# Altium schematic sheet HairColorDispenser.SchDoc: Hair Dispenser
size A3; DrawnBy: Markov Marko; Engineer: Markov Marko; Organization: M2Embedded; Address1: 21000 Novi Sad; Address2: Serbia; Address3: markov_marko@hotmail.com; Revision: 1.00; SheetNumber: 1; SheetTotal: 1; Design Engeneer:: Markov Marko
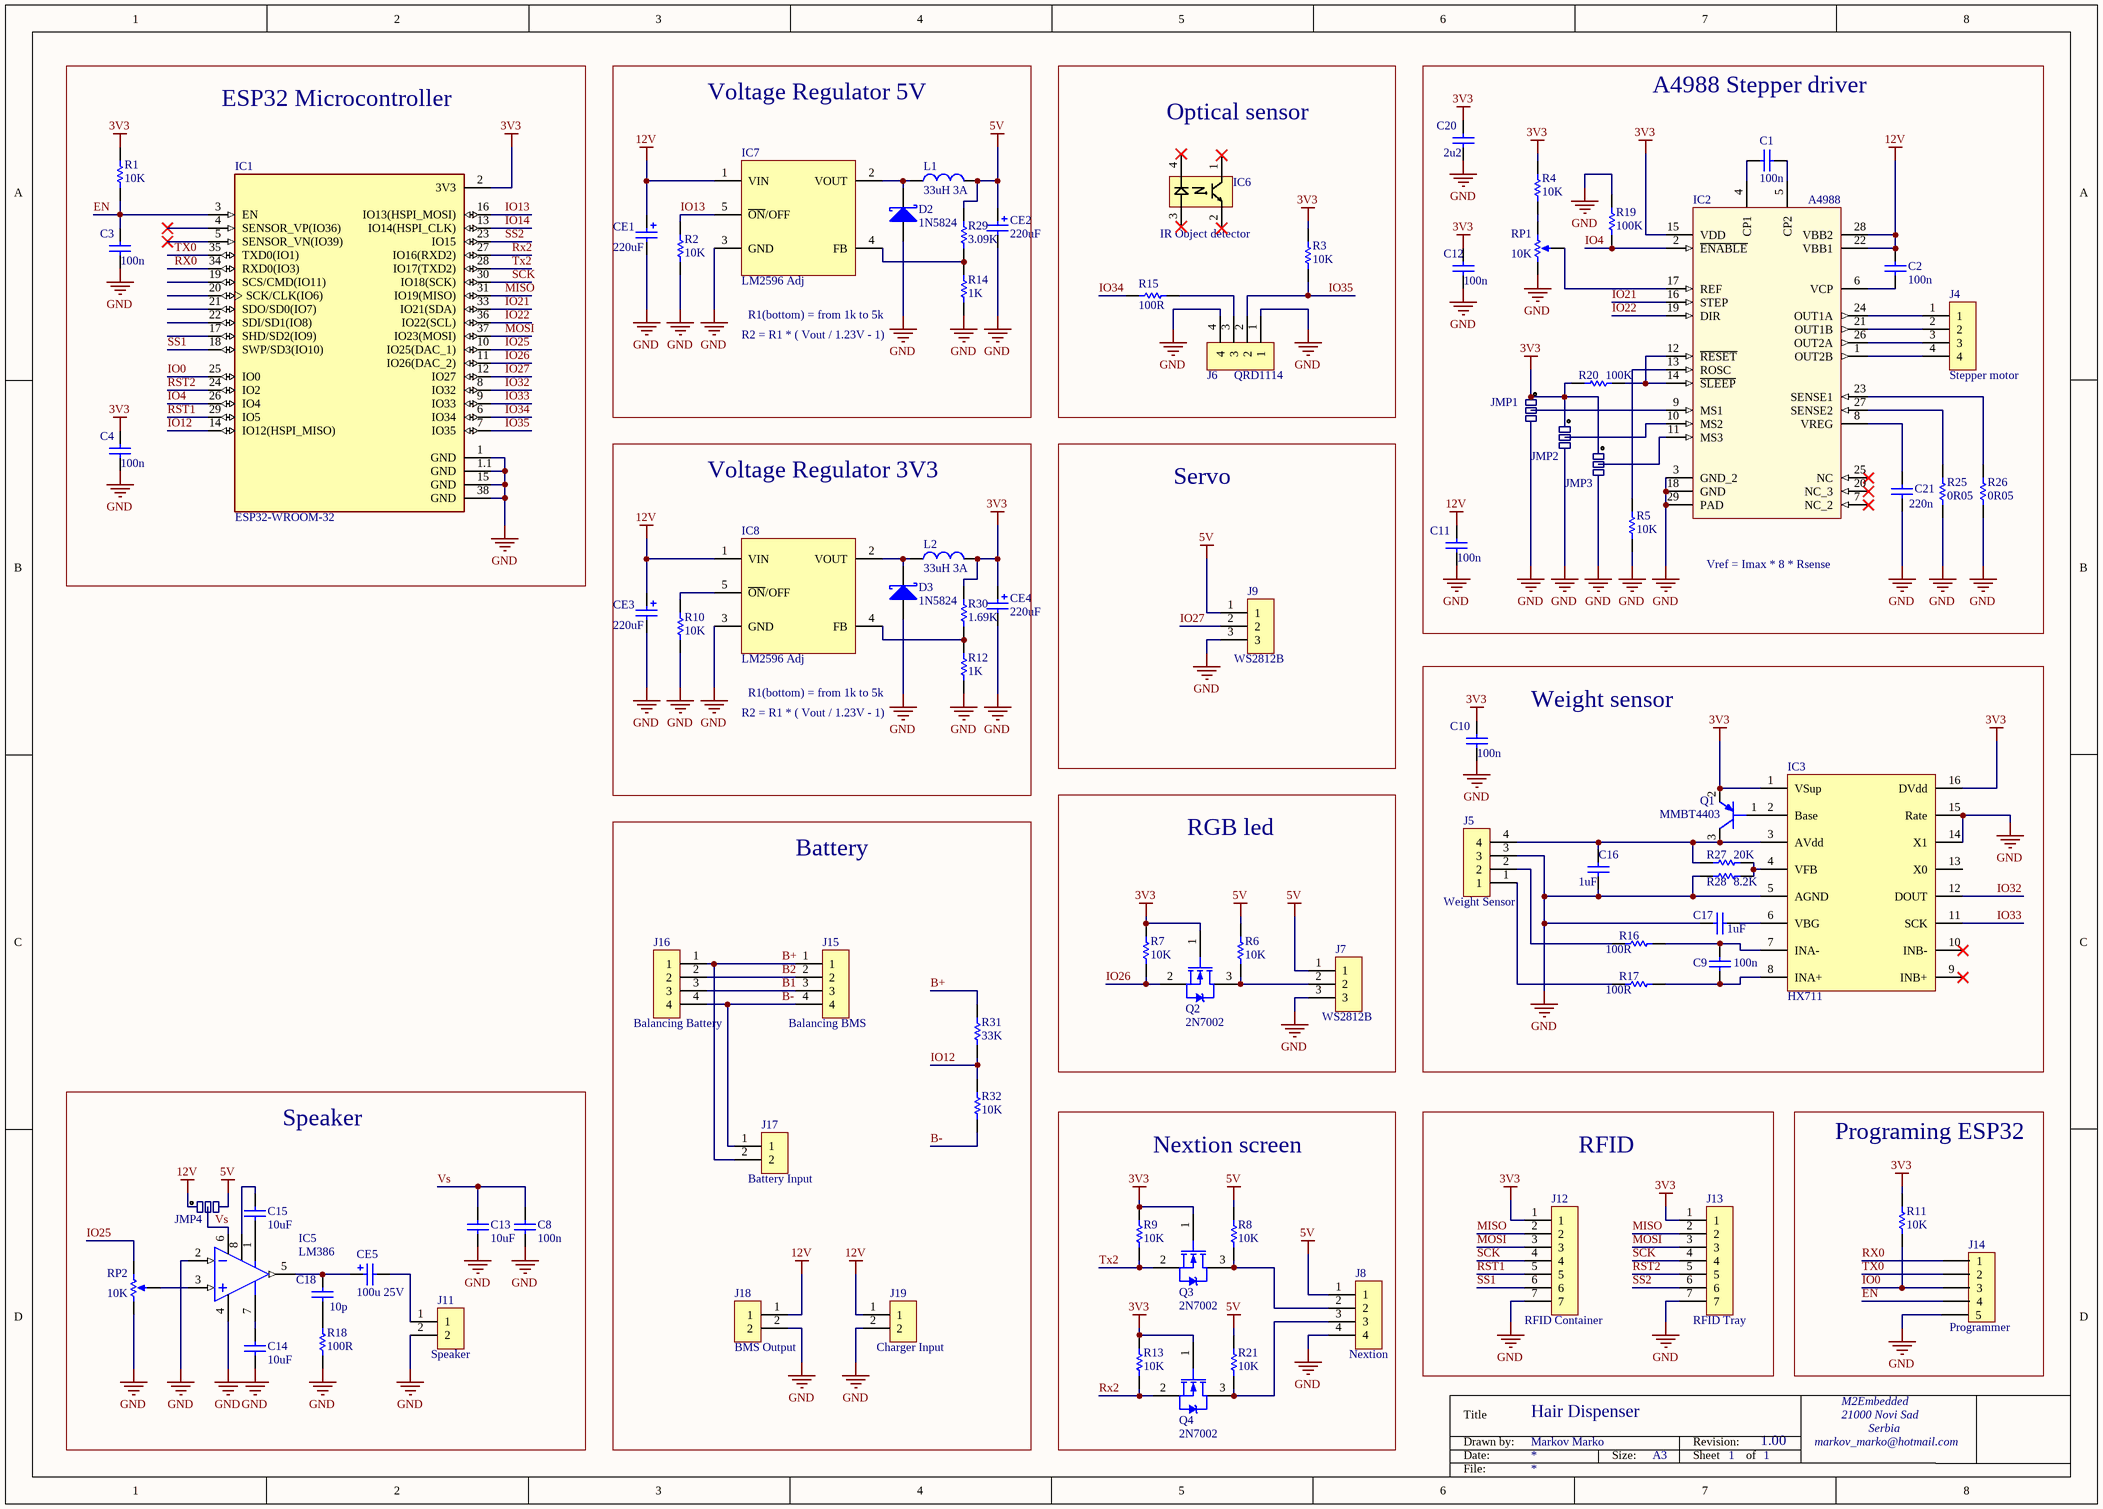
[diagram p0: HairColorDispenser.SchDoc]

## Parts
C1  100n  [CAPC3216X18N]
C2  100n  [CAPC3216X18N]
C3  100n  [CAPC3216X18N]
C4  100n  [CAPC3216X18N]
C8  100n  [CAPC3216X18N]
C9  100n  [CAPC3216X18N]
C10  100n  [CAPC3216X18N]
C11  100n  [CAPC3216X18N]
C12  100n  [CAPC3216X18N]
C13  10uF  [CAPC3216X18N]
C14  10uF  [CAPC3216X18N]
C15  10uF  [CAPC3216X18N]
C16  1uF  [CAPC3216X18N]
C17  1uF  [CAPC3216X18N]
C18  10p  [CAPC3216X18N]
C20  2u2  [CAPC3216X18N]
C21  220n  [CAPC3216X18N]
CE1  220uF  [220uF 35V]
CE2  220uF  [220uF 35V]
CE3  220uF  [220uF 35V]
CE4  220uF  [220uF 35V]
CE5  100u 25V  [CAPAE800X550N]
D2  1N5824  [SOD128]
D3  1N5824  [SOD128]
IC1  ESP32-WROOM-32  [MODULE_ESP-WROOM-32]
IC2  A4988  [28-QFN (5x5)]
IC3  HX711  [SOP16]
IC5  LM386  [SOIC-8]
IC6  IR Object detector  [QRD1114]  (no BOM)
IC7  LM2596 Adj  [TO263-5]
IC8  LM2596 Adj  [TO263-5]
J4  Stepper motor  [B4B-HX-A]
J5  Weight Sensor  [B4B-HX-A]
J6  QRD1114  [B4B-HX-A]
J7  WS2812B  [B3B-HX-A]
J8  Nextion  [B4B-HX-A]
J9  WS2812B  [B3B-HX-A]
J11  Speaker  [B2B-XH-A]
J12  RFID Container  [B7B-HX-A]
J13  RFID Tray  [B7B-HX-A]
J14  Programmer  [HEADER1X5]
J15  Balancing BMS  [B4B-HX-A]
J16  Balancing Battery  [B4B-HX-A]
J17  Battery Input  [B2B-XH-A]
J18  BMS Output  [B2B-XH-A]
J19  Charger Input  [B2B-XH-A]
JMP1  0R  [JMP_SOLDER_3]  (value not drawn)
JMP2  0R  [JMP_SOLDER_3]  (value not drawn)
JMP3  0R  [JMP_SOLDER_3]  (value not drawn)
JMP4  0R  [JMP_SOLDER_3]  (value not drawn)
L1  33uH 3A  [33uH 3A]
L2  33uH 3A  [33uH 3A]
Q1  MMBT4403  [SOT95P230X126-3N]
Q2  2N7002  [SOT95P230X126-3N]
Q3  2N7002  [SOT95P230X126-3N]
Q4  2N7002  [SOT95P230X126-3N]
R1  10K  [SMD 1206]
R2  10K  [SMD 1206]
R3  10K  [SMD 1206]
R4  10K  [SMD 1206]
R5  10K  [SMD 1206]
R6  10K  [SMD 1206]
R7  10K  [SMD 1206]
R8  10K  [SMD 1206]
R9  10K  [SMD 1206]
R10  10K  [SMD 1206]
R11  10K  [SMD 1206]
R12  1K  [SMD 1206]
R13  10K  [SMD 1206]
R14  1K  [SMD 1206]
R15  100R  [SMD 1206]
R16  100R  [SMD 1206]
R17  100R  [SMD 1206]
R18  100R  [SMD 1206]
R19  100K  [SMD 1206]
R20  100K  [SMD 1206]
R21  10K  [SMD 1206]
R25  0R05  [SMD 1206]
R26  0R05  [SMD 1206]
R27  20K  [SMD 1206]
R28  8.2K  [SMD 1206]
R29  3.09K  [SMD 1206]
R30  1.69K  [SMD 1206]
R31  33K  [SMD 1206]
R32  10K  [SMD 1206]
RP1  10K  [SMD POT]
RP2  10K  [SMD POT]

## Blocks framed on the sheet
ESP32 Microcontroller: C3 C4 IC1 R1
Voltage Regulator 5V: CE1 CE2 D2 IC7 L1 R2 R14 R29
Optical sensor: IC6 J6 R3 R15
A4988 Stepper driver: C1 C2 C11 C12 C20 C21 IC2 J4 JMP1-JMP3 R4 R5 R19 R20 R25 R26 RP1
Voltage Regulator 3V3: CE3 CE4 D3 IC8 L2 R10 R12 R30
Servo: J9
Weight sensor: C9 C10 C16 C17 IC3 J5 Q1 R16 R17 R27 R28
Battery: J15-J19 R31 R32
RGB led: J7 Q2 R6 R7
Speaker: C8 C13-C15 C18 CE5 IC5 J11 JMP4 R18 RP2
Nextion screen: J8 Q3 Q4 R8 R9 R13 R21
RFID: J12 J13
Programing ESP32: J14 R11

## Nets
3V3: C4.2 C10.2 C12.2 C20.2 CE4.1 IC1.2(3V3) IC2.15(VDD) IC3.1(VSup) IC3.16(DVdd) J12.1 J13.1 JMP1.1 JMP2.1 JMP3.1 L2.2 Q1.2(E) Q2.1(G) Q3.1(G) Q4.1(G) R1.2 R3.2 R4.2 R7.2 R9.2 R11.1 R13.2 R20.2 R30.1
5V: CE2.1 J7.1 J8.1 J9.1 JMP4.3 L1.2 R6.1 R8.1 R21.1 R29.1
12V: C2.2 C11.2 CE1.1 CE3.1 IC2.22(VBB1) IC2.28(VBB2) IC7.1(VIN) IC8.1(VIN) J18.1 J19.1 JMP4.1
GND: C3.1 C4.1 C8.1 C10.1 C11.1 C12.1 C13.1 C14.1 C16.1 C17.1 C20.1 C21.1 CE1.2 CE2.2 CE3.2 CE4.2 D2.2(A) D3.2(A) IC1.1(GND) IC1.1.1(GND) IC1.15(GND) IC1.38(GND) IC2.3(GND_2) IC2.18(GND) IC2.29(PAD) IC3.5(AGND) IC3.14(X1) IC3.15(Rate) IC5.2(IN-) IC5.4(V-) IC7.3(GND) IC8.3(GND) J5.3 J6.1 J6.4 J7.3 J8.4 J9.3 J11.2 J12.7 J13.7 J14.5 J18.2 J19.2 JMP1.3 JMP2.3 JMP3.3 R2.1 R5.1 R10.1 R12.1 R14.1 R18.2 R19.2 R25.2 R26.2 R28.1 RP1.1(CCW) RP2.1(CCW)
B1: J15.3 J16.3
B2: J15.2 J16.2
B+: J15.1 J16.1 J17.2 R31.2
B-: J15.4 J16.4 J17.1 R32.1
EN: C3.2 IC1.3(EN) J14.4 R1.1
IO0: IC1.25(IO0) J14.3 R11.2
IO4: IC1.26(IO4) IC2.2(~{ENABLE}) R19.1
IO12: IC1.14(IO12(HSPI_MISO)) R31.1 R32.2
IO13: IC1.16(IO13(HSPI_MOSI)) IC7.5(~{ON}/OFF) R2.2
IO14: IC1.13(IO14(HSPI_CLK))
IO21: IC1.33(IO21(SDA)) IC2.16(STEP)
IO22: IC1.36(IO22(SCL)) IC2.19(DIR)
IO25: IC1.10(IO25(DAC_1)) RP2.3(CW)
IO26: IC1.11(IO26(DAC_2)) Q2.2(S) R7.1
IO27: IC1.12(IO27) J9.2
IO32: IC1.8(IO32) IC3.12(DOUT)
IO33: IC1.9(IO33) IC3.11(SCK)
IO34: IC1.6(IO34) R15.1
IO35: IC1.7(IO35) J6.2 R3.1
MISO: IC1.31(IO19(MISO)) J12.2 J13.2
MOSI: IC1.37(IO23(MOSI)) J12.3 J13.3
RST1: IC1.29(IO5) J12.5
RST2: IC1.24(IO2) J13.5
RX0: IC1.34(RXD0(IO3)) J14.1
Rx2: IC1.27(IO16(RXD2)) Q4.2(S) R13.1
SCK: IC1.30(IO18(SCK)) J12.4 J13.4
SS1: IC1.18(SWP/SD3(IO10)) J12.6
SS2: IC1.23(IO15) J13.6
TX0: IC1.35(TXD0(IO1)) J14.2
Tx2: IC1.28(IO17(TXD2)) Q3.2(S) R9.1
Vs: C8.2 C13.2 IC5.6(Vcc) JMP4.2
NetC1_1: C1.1 IC2.4(CP1)
NetC1_2: C1.2 IC2.5(CP2)
NetC2_1: C2.1 IC2.6(VCP)
NetC9_1: C9.1 IC3.8(INA+) R17.2
NetC9_2: C9.2 IC3.7(INA-) R16.2
NetC14_2: C14.2 IC5.7(Bypass)
NetC15_1: C15.1 IC5.1(REF_1)
NetC15_2: C15.2 IC5.8(GAIN)
NetC16_2: C16.2 IC3.3(AVdd) J5.4 Q1.3(C) R27.1
NetC17_2: C17.2 IC3.6(VBG)
NetC18_1: C18.1 CE5.1 IC5.5(OUT)
NetC18_2: C18.2 R18.1
NetC21_2: C21.2 IC2.8(VREG)
NetCE5_2: CE5.2 J11.1
NetD2_1: D2.1(K) IC7.2(VOUT) L1.1
NetD3_1: D3.1(K) IC8.2(VOUT) L2.1
NetIC2_1: IC2.1(OUT2B) J4.4
NetIC2_9: IC2.9(MS1) JMP1.2
NetIC2_10: IC2.10(MS2) JMP2.2
NetIC2_11: IC2.11(MS3) JMP3.2
NetIC2_12: IC2.12(~{RESET}) IC2.14(~{SLEEP}) R20.1
NetIC2_13: IC2.13(ROSC) R5.2
NetIC2_17: IC2.17(REF) RP1.2(WIPER)
NetIC2_21: IC2.21(OUT1B) J4.2
NetIC2_23: IC2.23(SENSE1) R26.1
NetIC2_24: IC2.24(OUT1A) J4.1
NetIC2_26: IC2.26(OUT2A) J4.3
NetIC2_27: IC2.27(SENSE2) R25.1
NetIC3_2: IC3.2(Base) Q1.1(B)
NetIC3_4: IC3.4(VFB) R27.2 R28.2
NetIC5_3: IC5.3(IN+) RP2.2(WIPER)
NetIC7_4: IC7.4(FB) R14.2 R29.2
NetIC8_4: IC8.4(FB) R12.2 R30.2
NetIC8_5: IC8.5(~{ON}/OFF) R10.2
NetJ5_1: J5.1 R17.1
NetJ5_2: J5.2 R16.1
NetJ6_3: J6.3 R15.2
NetJ7_2: J7.2 Q2.3(D) R6.2
NetJ8_2: J8.2 Q3.3(D) R8.2
NetJ8_3: J8.3 Q4.3(D) R21.2
NetR4_1: R4.1 RP1.3(CW)

Not connected (* = marked no-connect by the designer): IC1 4(SENSOR_VP(IO36))* 5(SENSOR_VN(IO39))* 17(SHD/SD2(IO9)) 19(SCS/CMD(IO11)) 20(SCK/CLK(IO6)) 21(SDO/SD0(IO7)) 22(SDI/SD1(IO8)); IC2 7(NC_2)* 20(NC_3)* 25(NC)*; IC3 9(INB+)* 10(INB-)* 13(X0); IC6 1(C)* 2(E)* 3(A)* 4(K)*

## Notes on the sheet
- R1(bottom) = from 1k to 5k
- R2 = R1 * ( Vout / 1.23V - 1)
- Vref = Imax * 8 * Rsense
- Title
- Drawn by:
- Date:
- Size:
- A3
- Revision:
- Sheet
- of
- File:

## Library data of the parts
C1 C2 = 100n 25V NP0: CAP CER 0.1UF 25V NP0 1206; Manufacturer: Murata Electronics North America; Manufacturer Code: GRM31C5C1E104JA01L; Ordering Code: 490-1767-1-ND; Distributor: Digi-Key; Value: 100n
C3 C4 C8-C12 = 100n 50V X7R: CAP CER 0.1UF 50V X7R 1206; Manufacturer: KEMET; Manufacturer Code: C1206C104K5RAC7800; Ordering Code: 399-C1206C104K5RAC7800CT-ND; Distributor: Digi-Key; Value: 100n
C13-C15 = 10uF 25V X7R: CAP CER 10UF 25V X5R 1206; Manufacturer: KEMET; Manufacturer Code: C1206C106M3PACTU; Ordering Code: 399-8153-1-ND; Distributor: Digi-Key; Value: 10uF
C16 C17 = 1uF 25V X7R: CAP CER 1UF 25V X7R 1206; Manufacturer: KEMET; Manufacturer Code: C1206C105M3RACTU; Ordering Code: 399-8148-1-ND; Distributor: Digi-Key; Value: 1uF
C18 = 10p 50V X7R: CAP CER 10pF 50V NP0 1206; Manufacturer: KEMET; Manufacturer Code: C1206C100J5GACAUTO; Ordering Code: 399-C1206C100J5GACAUTOCT-ND; Distributor: Digi-Key; Value: 10p
C20 = 2u2 50V X7R: CAP CER 2.2UF 50V X7R 1206; Manufacturer: KEMET; Manufacturer Code: C1206C225K5RACAUTO; Ordering Code: 399-7019-1-ND; Distributor: Digi-Key; Value: 2u2
C21 = 220n 50V X7R: CAP CER 0.22UF 50V X7R 1206; Manufacturer: KEMET; Manufacturer Code: C1206C224K5RACTU; Ordering Code: 399-1251-1-ND; Distributor: Digi-Key; Value: 220n
CE1-CE4 = 220u 35V: CAP ALUM 220UF 20% 35V SMD; Manufacturer Code: UWT1V221MNL1GS; Manufacturer: Nichicon; Ordering code: 493-2205-1-ND; Value: 220uF; Distributor: Digi-Key
CE5 = 100u 25V h=5.4mm: CAPAE800X700 CASE E PANASONIC_EEEFK1E101P; Manufacturer Code: UWX1E101MCL1GB; Manufacturer: Nichicon; Ordering code: 493-2113-1-ND; Value: 100u 25V; Distributor: Digi-Key
D2 D3 = 1N5824: DIODE SCHOTTKY 30V 5A MFLAT; Manufacturer: Toshiba Semiconductor and Storage; Manufacturer code: CMS04(TE12L,Q,M); Ordering Code: 1N5819HW-FDICT-ND; Distributor: Digi-Key; Value: 1N5824
IC1 = ESP32-WROOM-32: Bluetooth, WiFi Transceiver Module 2.4GHz ~ 2.5GHz Surface Mount; Manufacturer: Espressif Systems; Ordering Code: 1904-1010-1-ND; Distributor: DigiKey; Manufacturer Code: ESP32-WROOM-32
IC2 = A4988: IC MTR DRVR BIPOLAR 3-5.5V 28QFN; Manufacturer Code: A4988SETTR-T; Manufacturer: Allegro MicroSystems; Ordering Code: 620-1343-1-ND; Distributor: DigiKey
IC3 = HX711: LOAD CELL AMP HX711; Distributor: AliExpress; Manufacturer Code: HX711
IC5 = LM386: IC AMP AUDIO PWR .325W AB 8SOIC; Manufacturer: Texas Instruments; Manufacturer Code: LM386MX-1/NOPB; Ordering Code: LM386MX-1/NOPBCT-ND; Distributor: Digi-Key
IC6 = QRD1114: SENSR OPTO TRANS 1.27MM REFL PCB; Manufacturer: ON Semiconductor; Distibutor: Digi-Key; Ordering code: QRD1114-ND; Manufacturer code: QRD1114
IC7 IC8 = LM2596 Adj: IC REG MULT CONFG ADJ 3A D2PAK-5; Manufacturer Code: LM2596DSADJG; Manufacturer: ON Semiconductor; Ordering Code: LM2596DSADJGOS-ND; Distributor: Digi-Key
J4-J6 J8 J15 J16 = JST 4-Pin 2.5mm B4B-XH-A: CONN HEADER XH TOP 2POS 2.5MM; Manufacturer: JST Sales America Inc.; Manufacturer Code: B4B-XH-A(LF)(SN); Order Code: 455-2249-ND; Distributor: Digi-Key
J7 J9 = JST 3-Pin 2.5mm B3B-XH-A: CONN HEADER XH TOP 2POS 2.5MM; Manufacturer: JST Sales America Inc.; Manufacturer Code: B3B-XH-A(LF)(SN); Order Code: 455-2248-ND; Distributor: Digi-Key
J11 J17-J19 = JST 2-Pin 2.5mm B2B-XH-A: CONN HEADER XH TOP 2POS 2.5MM; Manufacturer: JST Sales America Inc.; Manufacturer Code: B2B-XH-A(LF)(SN); Order Code: 455-2247-ND; Distributor: Digi-Key
J12 J13 = JST 7-Pin 2.5mm B7B-XH-A: CONN HEADER VERT 7POS 2.5MM; Manufacturer: JST Sales America Inc.; Manufacturer Code: B7B-XH-A(LF)(SN); Order Code: 455-2252-ND; Distributor: Digi-Key
J14 = Header 1x5: CONN HEADER VERT 5POS 2.54MM; Manufacturer: Harwin Inc.; Manufacturer Code: M20-9990546; Ordering Code: 952-2268-ND; Distributor: Digi-Key
JMP1-JMP4 = JMP-3 0R0 0603: Solder Jumper 3x0603
L1 L2 = IND 33u 3A: FIXED IND 33UH 3A 60 MOHM SMD; Manufacturer: Bourns Inc.; Manufacturer Code: SRR1260-330M; Ordering Code: SRR1260-330MTR-ND; Distributor: Digi-Key; Value: 33uH 3A
Q1 = MMBT4403: PNP 40V 600mA 200MHz 300mW SOT-23-3; Manufacturer: ON Semiconductor; Manufacturer Code: MMBT4403LT1G; Ordering Code: MMBT4403LT1GOSCT-ND; Distributor: Digi-Key
Q2-Q4 = 2N7002: MOSFET N-CH 60V 115mA SOT-23; Manufacturer: ON Semiconductor; Ordering Code: 2N7002NCT-ND; Distributor: Digi-Key; Manufacturer Code: 2N7002
R1-R11 R13 R21 R32 = 10K 1% 0.25W: RES SMD 10K OHM 1% 1/4W 1206; Manufacturer: Yageo; Manufacturer Code: RC1206FR-0710KL; Ordering Code: 311-10.0KFRCT-ND; Distributor: Digi-Key
R12 R14 = 1K 1% 0.25W: RES SMD 1K OHM 1% 1/4W 1206; Manufacturer: Yageo; Manufacturer Code: RC1206FR-071KL; Ordering Code: 311-1.00KFRCT-ND; Value: 1K; Distributor: Farnell
R15-R18 = 100R 1% 0.25W: RES SMD 100 OHM 1% 1/4W 1206; Manufacturer: Yageo; Manufacturer Code: RC1206FR-07100RL; Ordering Code: 311-100FRCT-ND; Distributor: Digi-Key; Value: 100R
R19 R20 = 100K 1% 0.25W: RES SMD 100K OHM 1% 1/4W 1206; Manufacturer: Yageo; Manufacturer Code: RC1206FR-07100KL; Ordering Code: 311-100KFRCT-ND; Distributor: Digi-Key; Value: 100K
R25 R26 = 0R05 0.5% 0.5W: RES 50M OHM 0.5% 1/2W 1206; Manufacturer: Ohmite; Manufacturer Code: KDV12DR050ET; Order Code: 273-KDV12DR050ETCT-ND; Distributor: Digi-Key; Value: 0R05
R27 = 20K 1% 0.25W: RES SMD 20K OHM 1% 1/4W 1206; Manufacturer: Yageo; Manufacturer Code: RC1206FR-0720KL; Ordering Code: 311-20.0KFRCT-ND; Distributor: Digi-Key; Value: 20K
R28 = 8K2 1% 0.25W: RES SMD 8.2K OHM 5% 1/4W 1206; Manufacturer: Yageo; Manufacturer Code: RC1206JR-078K2L; Ordering Code: 311-8.2KERCT-ND; Distributor: Digi-Key
R29 = 3.09K 1% 0.25W: RES SMD 3.09K OHM 1% 0.25W 1206; Manufacturer: Yageo; Manufacturer Code: RC1206FR-073K09L; Order Code: 311-3.09KFRCT-ND; Distributor: Digi-Key; Value: 3.09K
R30 = 1.69K 1% 0.25W_1: RES SMD 1.69K OHM 1% 0.25W 1206; Manufacturer: Yageo; Manufacturer Code: RC1206FR-071K69L; Order Code: 311-1.69KFRCT-ND; Distributor: Digi-Key; Value: 1.69K
R31 = 33K 1% 0.25W: RESISTOR, POWER, 1206, 1%, 33K; Manufacturer: Yageo; Manufacturer Code: RC1206FR-0733KL; Ordering Code: 311-33.0KFRCT-ND; Distributor: Digi-Key; Value: 33K
RP1 RP2 = 10k POT SMD: TRIMMER 10K OHM 0.1W SMD; Manufacturer: Bourns Inc.; Manufacturer Code: TC33X-2-103E; Ordering Code: TC33X-103ECT-ND; Distributor: Digi-Key